# EAGLE design radio (EAGLE 9.6.2)
REVISION: 3.2; SCH_DESC: Dual ISM43340 5GHz radio transciever.; TEAM: RoboCup SSL
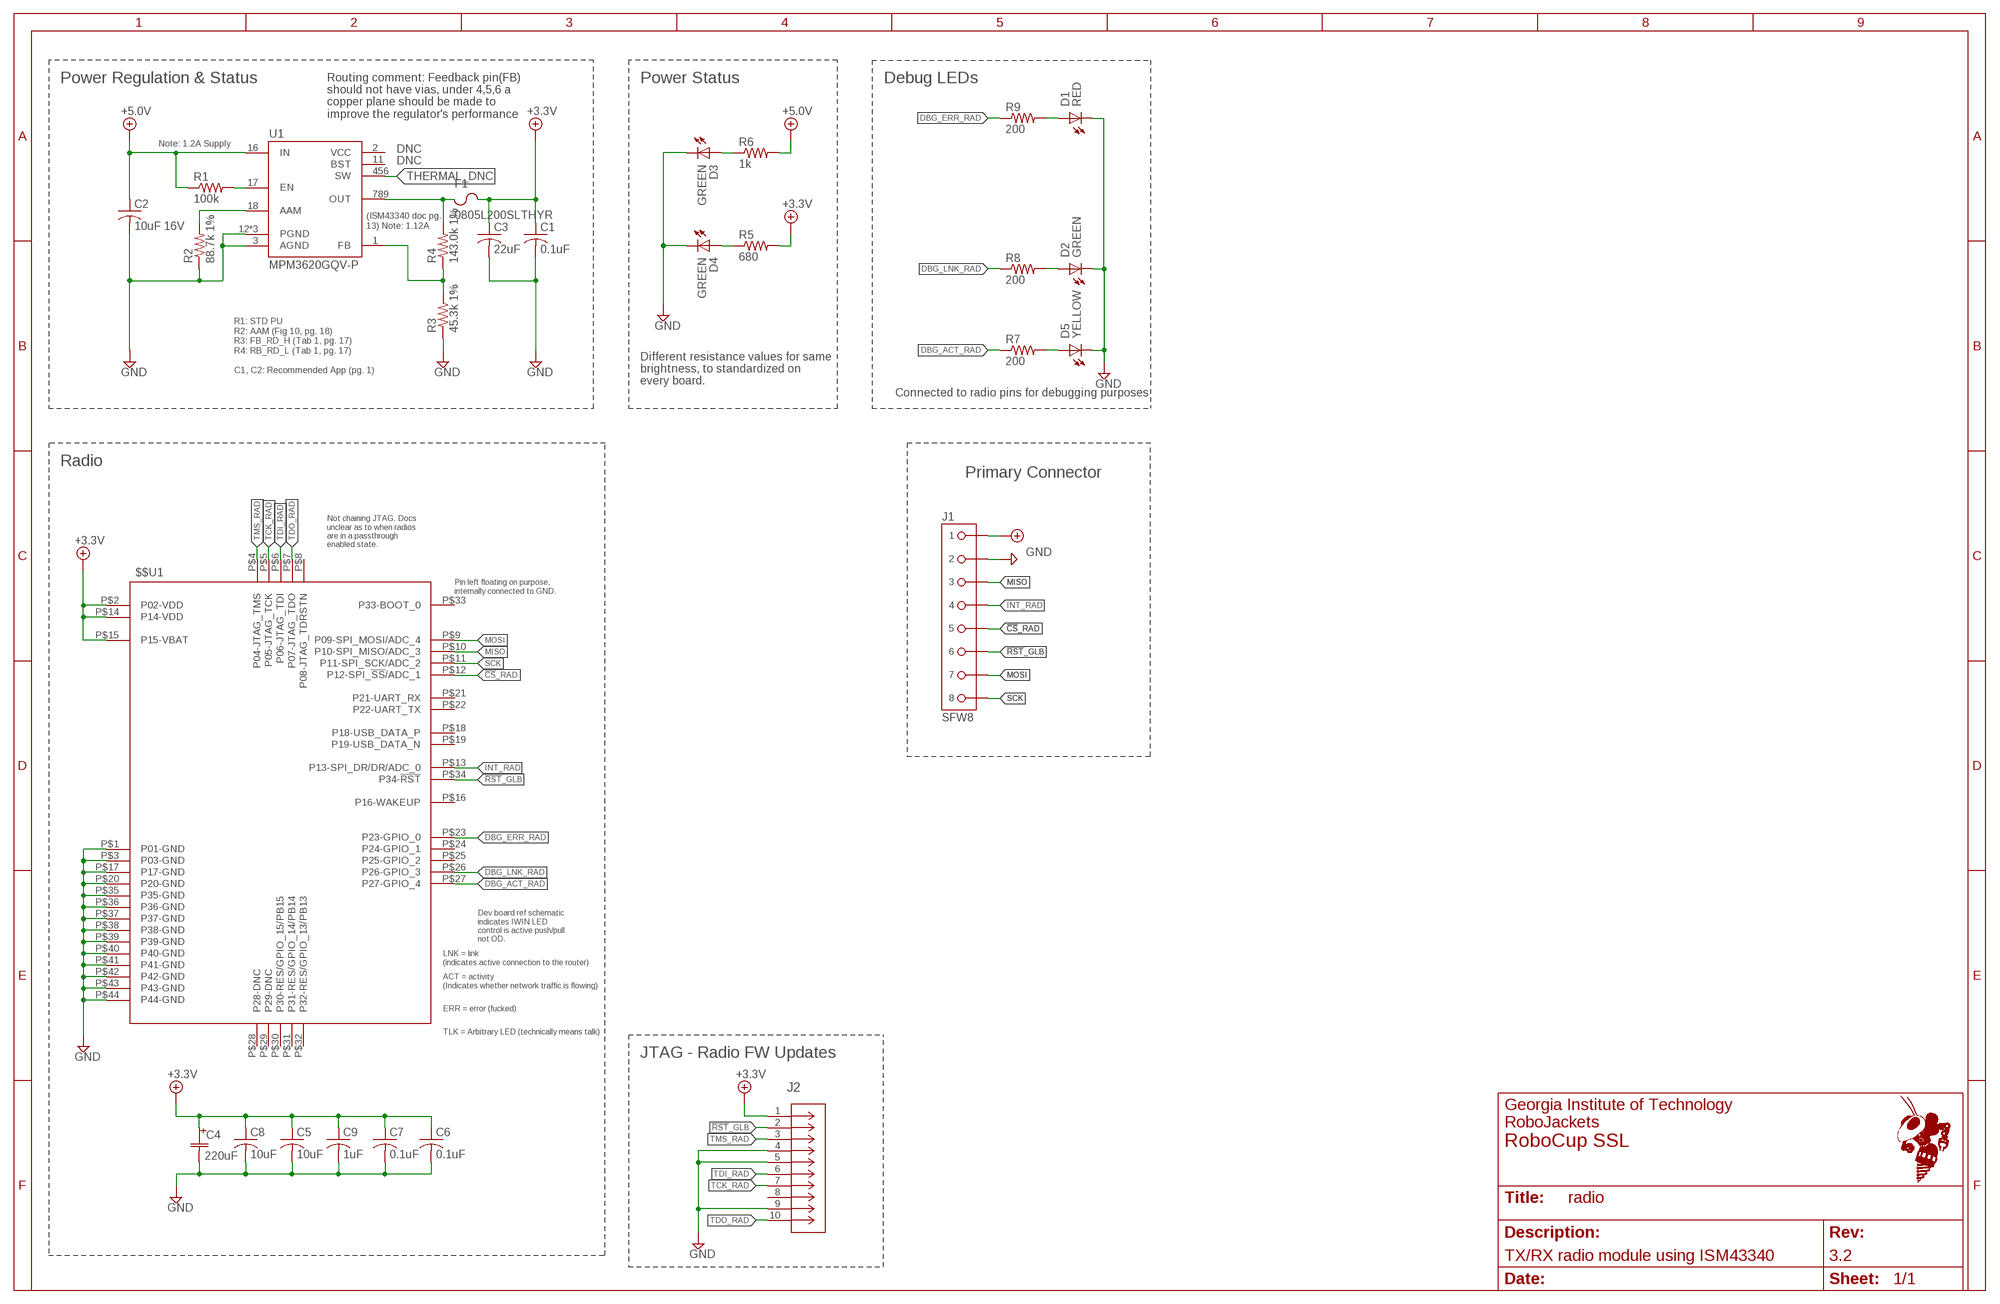
[diagram p0: schematic, sheet 1]
FRAME1 (FRAME_B_L): SCH_DESC: TX/RX radio module using ISM43340

## Parts
$$U1  ISM43340  [ISM43340]
C1  0.1uF  C-USC0603  [C0603]
C2  10uF 16V  C-USC1210  [C1210]
C3  22uF  C-USC1210  [C1210]
C4  220uF  ECA-1HHG221  [CAP_PAN_10X12.5]
C5  10uF  C-USC0805  [C0805]
C6  0.1uF  C-USC0603  [C0603]
C7  0.1uF  C-USC0603  [C0603]
C8  10uF  C-USC0805  [C0805]
C9  1uF  C-USC0603  [C0603]
D1  RED  LED-SMD-RED  [CHIP-LED0603]
D2  GREEN  LED-SMD-GREEN  [CHIP-LED0603]
D3  GREEN  LED-SMD-GREEN  [CHIP-LED0603]
D4  GREEN  LED-SMD-GREEN  [CHIP-LED0603]
D5  YELLOW  LED-SMD-YELLOW  [CHIP-LED0603]
F1  0805L200SLTHYR  CHIP_FUSE0805  [FUSC2113X75]
J1  SFW8  [SFW8R-1ST]
J2  FTSH-105-01-F-D-K  [CONN_FTSH-105-01-F-D-K_SAI]
R1  100k  R-US_R0603  [R0603]
R2  88.7k 1%  R-US_R0603  [R0603]
R3  45.3k 1%  R-US_R0603  [R0603]
R4  143.0k 1%  R-US_R0603  [R0603]
R5  680  R-US_R0603  [R0603]
R6  1k  R-US_R0603  [R0603]
R7  200  R-US_R0603  [R0603]
R8  200  R-US_R0603  [R0603]
R9  200  R-US_R0603  [R0603]
U1  MPM3620GQV-P  [MPM3620GQV-P]

## Nets
3V3_PWR_IND: D4.A R5.1
5V_PWR_IND: D3.A R6.1
!CS!_RAD: $$U1.P$12(P12-SPI_!SS!/ADC_1) J1.5
!RST!_GLB: $$U1.P$34(P34-!RST!) J1.6 J2.2
+3.3V: $$U1.P$2(P02-VDD) $$U1.P$14(P14-VDD) $$U1.P$15(P15-VBAT) C1.1 C3.1 C4.1 C5.1 C6.1 C7.1 C8.1 C9.1 F1.2 J2.1 R5.2
+5.0V: C2.1 J1.1 R1.1 R6.2 U1.16(IN)
AAM: R2.2 U1.18(AAM)
DBG_ACT_RAD: $$U1.P$27(P27-GPIO_4) R7.1
DBG_ERR: D1.A R9.2
DBG_ERR_RAD: $$U1.P$23(P23-GPIO_0) R9.1
DBG_LNK_RAD: $$U1.P$26(P26-GPIO_3) R8.1
DGB_ACT: D5.A R7.2
DGB_LNK: D2.A R8.2
EN: R1.2 U1.17(EN)
FB: R3.2 R4.1 U1.1(FB)
GND: $$U1.P$1(P01-GND) $$U1.P$3(P03-GND) $$U1.P$17(P17-GND) $$U1.P$20(P20-GND) $$U1.P$35(P35-GND) $$U1.P$36(P36-GND) $$U1.P$37(P37-GND) $$U1.P$38(P38-GND) $$U1.P$39(P39-GND) $$U1.P$40(P40-GND) $$U1.P$41(P41-GND) $$U1.P$42(P42-GND) $$U1.P$43(P43-GND) $$U1.P$44(P44-GND) C1.2 C2.2 C3.2 C4.2 C5.2 C6.2 C7.2 C8.2 C9.2 D1.C(K) D2.C(K) D3.C(K) D4.C(K) D5.C(K) J1.2 J2.4 J2.5 J2.9 R2.1 R3.1 U1.3(AGND) U1.12(PGND) U1.13(PGND) U1.14(PGND)
INT_RAD: $$U1.P$13(P13-SPI_DR/DR/ADC_0) J1.4
MISO: $$U1.P$10(P10-SPI_MISO/ADC_3) J1.3
MOSI: $$U1.P$9(P09-SPI_MOSI/ADC_4) J1.7
PRE-FUSE: F1.1 R4.2 U1.789(OUT)
SCK: $$U1.P$11(P11-SPI_SCK/ADC_2) J1.8
TCK_RAD: $$U1.P$5(P05-JTAG_TCK) J2.7
TDI_RAD: $$U1.P$6(P06-JTAG_TDI) J2.6
TDO_RAD: $$U1.P$7(P07-JTAG_TDO) J2.10
THERMAL_DNC: U1.456(SW)
TMS_RAD: $$U1.P$4(P04-JTAG_TMS) J2.3
Unconnected: $$U1.P$8(P08-JTAG_TDRSTN) $$U1.P$16(P16-WAKEUP) $$U1.P$18(P18-USB_DATA_P) $$U1.P$19(P19-USB_DATA_N) $$U1.P$21(P21-UART_RX) $$U1.P$22(P22-UART_TX) $$U1.P$24(P24-GPIO_1) $$U1.P$25(P25-GPIO_2) $$U1.P$28(P28-DNC) $$U1.P$29(P29-DNC) $$U1.P$30(P30-RES/GPIO_15/PB15) $$U1.P$31(P31-RES/GPIO_14/PB14) $$U1.P$32(P32-RES/GPIO_13/PB13) $$U1.P$33(P33-BOOT_0) J1.LEG1 J1.LEG2 J2.8 U1.2(VCC) U1.11(BST)

## Notes on the sheet
- Power Regulation & Status | Power Status | Debug LEDs
- Routing comment: Feedback pin(FB)
  should not have vias, under 4,5,6 a 
  copper plane should be made to 
  improve the regulator's performance
- Note: 1.2A Supply
- DNC
- DNC
- (ISM43340 doc pg. 
  13) Note: 1.12A
- R1: STD PU
  R2: AAM (Fig 10, pg. 18)
  R3: FB_RD_H (Tab 1, pg. 17)
  R4: RB_RD_L (Tab 1, pg. 17)
  
  C1, C2: Recommended App (pg. 1)
- Different resistance values for same
  brightness, to standardized on 
  every board.
- Connected to radio pins for debugging purposes
- Radio
- Primary Connector
- Not chaining JTAG. Docs 
  unclear as to when radios 
  are in a passthrough 
  enabled state.
- Pin left floating on purpose, 
  internally connected to GND.
- Dev board ref schematic 
  indicates IWIN LED 
  control is active push/pull 
  not OD.
- LNK = link 
  (indicates active connection to the router)
- ACT = activity 
  (Indicates whether network traffic is flowing)
- ERR = error (fucked)
- TLK = Arbitrary LED (technically means talk)
- JTAG - Radio FW Updates

## Library data of the parts
$$U1 = RoboJackets-RF:ISM43340: RX TXRX MODULE WIFI U.FL SMD Datasheet <https://www.inventeksys.com/wp-content/uploads/ISM4334x_M4G_L44_Functional_Spec.pdf>; DKPN: 1475-1050-ND
C1-C3 C5-C9 = rcl:C-US: CAPACITOR, American symbol; SPICEPREFIX: C
C4 = RoboJackets-Capacitors:ECA-1HHG221; DIGIKEY: P5572-ND; MANUFACTURER_PART_NUMBER: ECA-1HHG221
D1 = RoboJackets-LEDs:LED-SMD; DIGIKEY: 160-1447-1-ND; MPN: LTST-C191KRKT
D2-D4 = RoboJackets-LEDs:LED-SMD; DIGIKEY: 160-1446-1-ND; MPN: LTST-C191KGKT
D5 = RoboJackets-LEDs:LED-SMD; DIGIKEY: 160-1448-1-ND; MPN: LTST-C191KSKT
F1 = RoboJackets-Fuses:CHIP_FUSE
J1 = RoboJackets-Connectors:SFW8
J2 = Jlink-Connector:FTSH-105-01-F-D-K; COPYRIGHT: Copyright (C) 2022 Ultra Librarian. All rights reserved.; MANUFACTURER_PART_NUMBER: FTSH-105-01-F-D-K; MFR_NAME: Samtec Inc
R1 R2 R5-R9 = resistor:R-US_: RESISTOR, American symbol
R3 R4 = rcl:R-US_: RESISTOR, American symbol; SPICEPREFIX: R
U1 = RoboJackets-PowerICs:MPM3620GQV-P

## Board
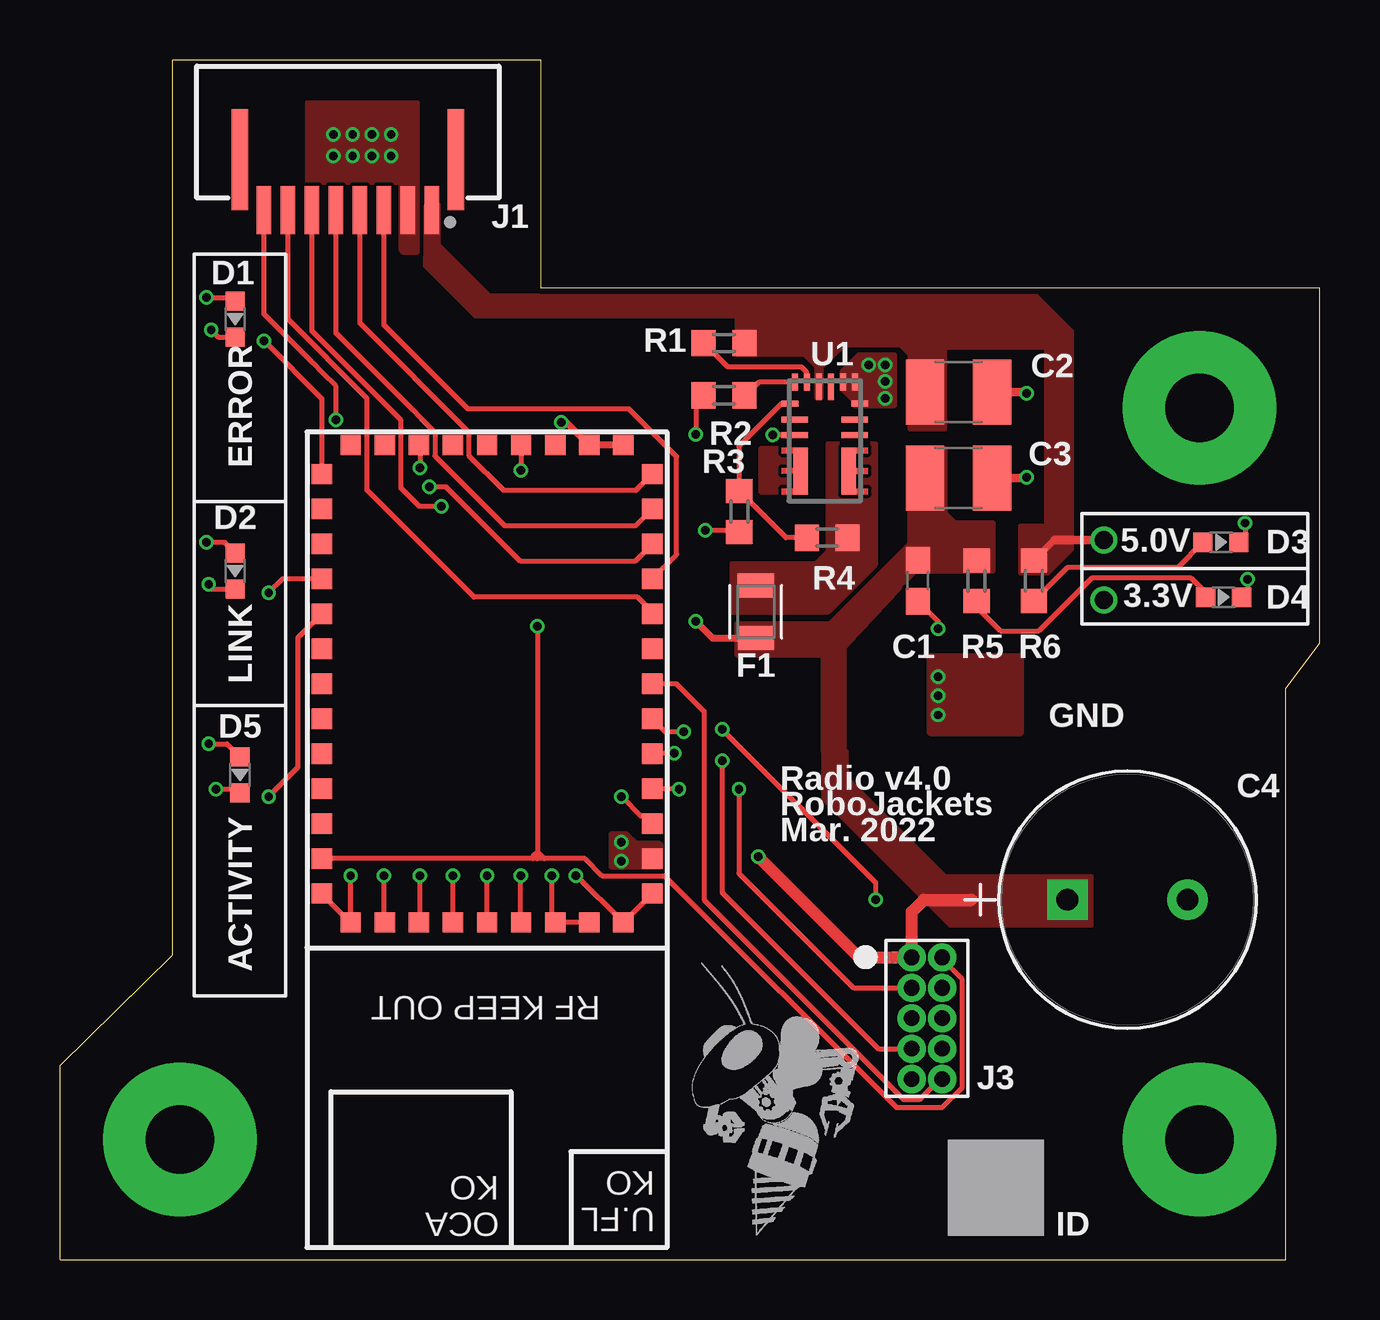
[diagram p1: board, top side]
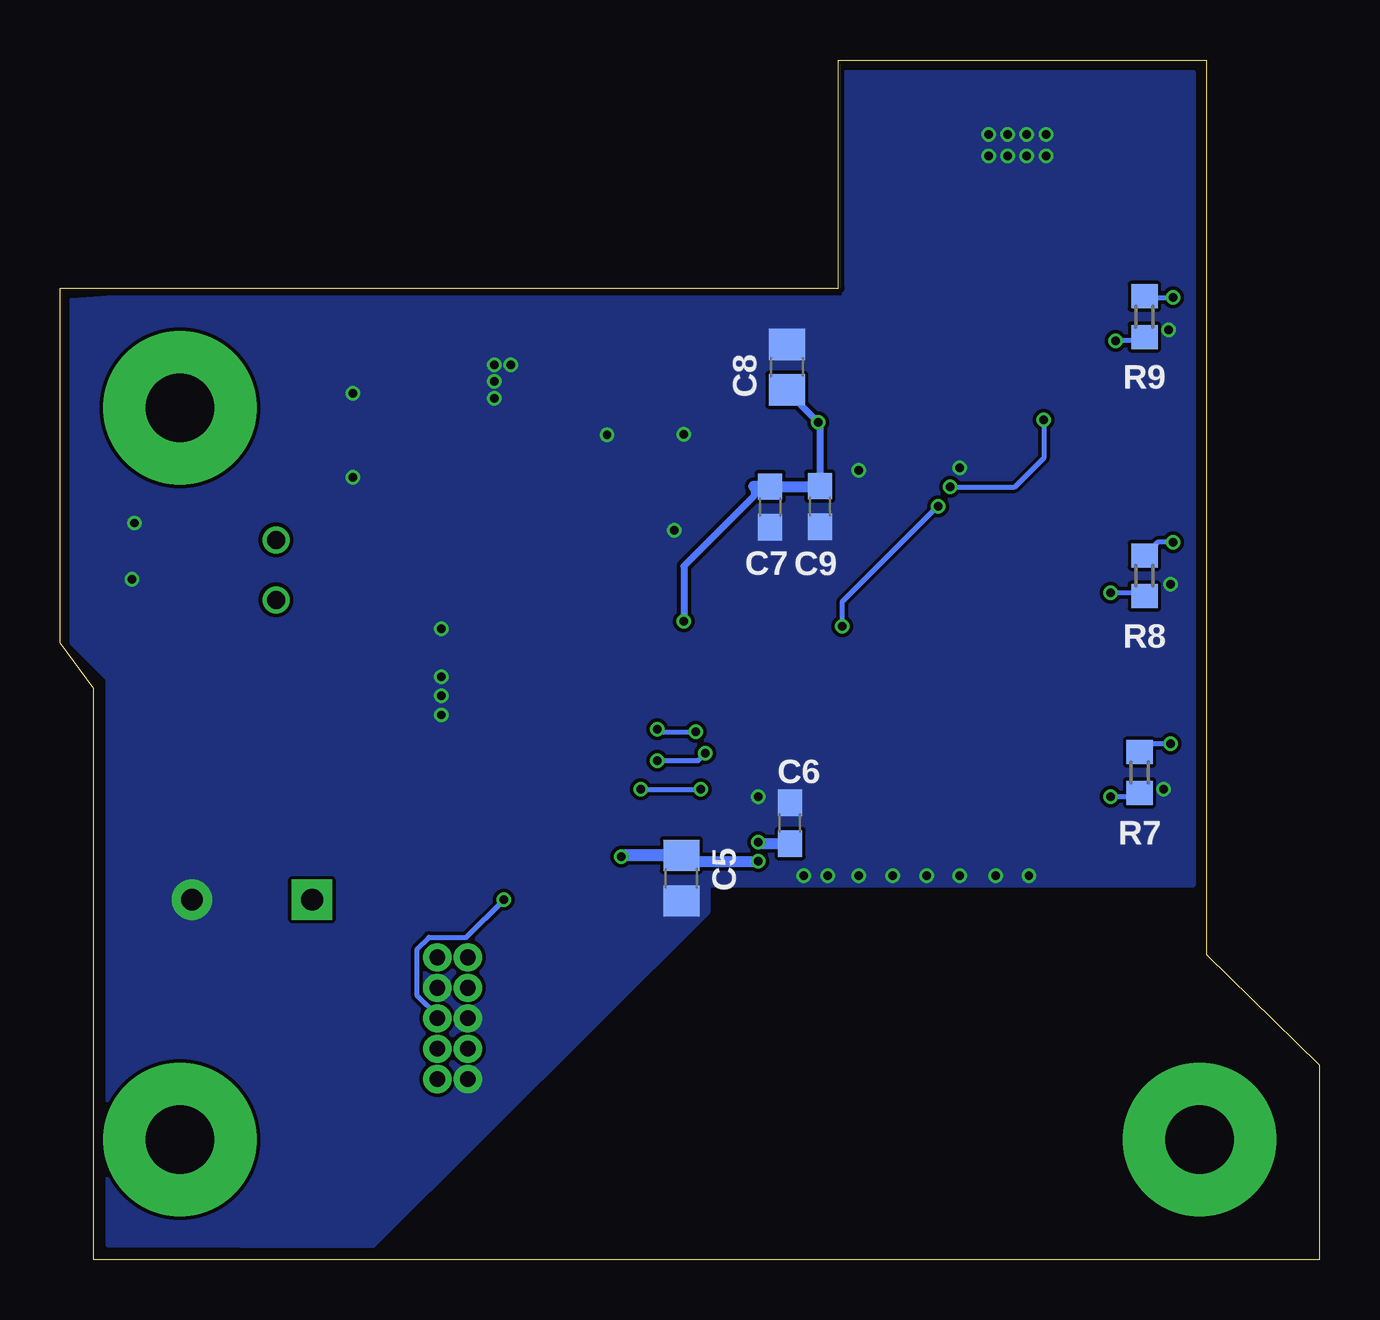
[diagram p2: board, bottom side, seen from below]

Size 52.5 x 50 mm. Coordinates in mm from the lower left corner, seen from the top.
Outline: 0,0 51.1,0 51.1,23.8 52.5,25.7 52.5,40.5 20.05,40.5 20.05,50 4.7,50 4.7,12.7 0,8.1 0,0
Copper layers (1*16): Top 0.018mm / dielectric 1.55mm / Bottom 0.018mm
Design rules "eC_2Layer_PClass6_BaseCopperO18_eCDefault *": minimum track width 0.15mm, minimum drill 0.35mm, track to track 0.15mm, track to pad 0.15mm, pad to pad 0.15mm, via to via 0.15mm, smd to smd 0mil, copper to edge 0.25mm, drill to drill 0.35mm, minimum pad ring 0.175mm, minimum via ring 0.125mm, stop-mask expansion 0mil, vias tented up to drill 0.45mm, thermal gap 0.2mm

### Footprints (pad centres in the part's own frame; a part is rotated, then mirrored left to right if it is on the bottom)
ISM43340 = smd 0.847 x 0.847: P$1 8.742,6.89; P$2 7.285,6.89; P$3 5.828,6.89; P$4 4.371,6.89; P$5 2.914,6.89; P$6 1.457,6.89; P$7 0,6.89; P$8 -1.457,6.89; P$9 -2.914,6.89; P$10 -4.371,6.89; P$11 -5.828,6.89; P$12 -7.285,6.89; P$13 -8.742,6.89; P$14 -9.948,5.684; P$15 -9.948,4.263; P$16 -9.948,2.842; P$17 -9.948,1.421; P$18 -9.948,0; P$19 -9.948,-1.421; P$20 -9.948,-2.842; P$21 -9.948,-4.263; P$22 -9.948,-5.684; P$23 -8.742,-6.89; P$24 -7.285,-6.89; P$25 -5.828,-6.89; P$26 -4.371,-6.89; P$27 -2.914,-6.89; P$28 -1.457,-6.89; P$29 0,-6.89; P$30 1.457,-6.89; P$31 2.914,-6.89; P$32 4.371,-6.89; P$33 5.828,-6.89; P$34 7.285,-6.89; P$35 8.742,-6.89; P$36 9.948,-5.684; P$37 9.948,-4.263; P$38 9.948,-2.842; P$39 9.948,-1.421; P$40 9.948,0; P$41 9.948,1.421; P$42 9.948,2.842; P$43 9.948,4.263; P$44 9.948,5.684
C0603 = smd 1.1 x 1: 1 -0.85,0; 2 0.85,0
C1210 = smd 1.6 x 2.7: 1 -1.4,0; 2 1.4,0
CAP_PAN_10X12.5 = drill 0.914 pad 1.676 square: 1 -5.004,0 | drill 0.914 pad 1.676: 2 0,0
C0805 = smd 1.3 x 1.5: 1 -0.95,0; 2 0.95,0
CHIP-LED0603 = smd 0.8 x 0.8: A 0,-0.75; C 0,0.75
FUSC2113X75 = smd 1 x 1.52: 1 -1.1,0 | smd 1 x 1.5: 2 1.1,0
SFW8R-1ST = smd 0.6 x 2: 1 -3.5,3.25; 2 -2.5,3.25; 3 -1.5,3.25; 4 -0.5,3.25; 5 0.5,3.25; 6 1.5,3.25; 7 2.5,3.25; 8 3.5,3.25 | smd 0.7 x 4.2: LEG1 -4.5,1.15; LEG2 4.5,1.15
CONN_FTSH-105-01-F-D-K_SAI = drill 0.66 pad 1.168: 1 0,0; 2 0,1.27; 3 1.27,0; 4 1.27,1.27; 5 2.54,0; 6 2.54,1.27; 7 3.81,0; 8 3.81,1.27; 9 5.08,0; 10 5.08,1.27
R0603 = smd 1 x 1.1: 1 -0.85,0; 2 0.85,0
MPM3620GQV-P = smd 0.7 x 0.25: 1 -1.45,1.55; 12 1.45,1.55 | smd 1.1 x 0.25: 2 -1.25,0.9; 3 -1.25,0.25; 10 1.25,0.25; 11 1.25,0.9 | smd 0.25 x 0.7: 13 1.25,2.45; 14 0.75,2.45; 17 -0.75,2.45; 18 -1.25,2.45 | smd 0.25 x 1.1: 15 0.25,2.25; 16 -0.25,2.25 | smd 0.6 x 1.95: 456 -1,-1.25; 789 1,-1.25

### Placement (x,y rotation side)
$$U1  17.8,24 270 top
C1  35.75,28.3 270 top
C2  37.45,36.16 0 top
C3  37.45,32.57 0 top
C4  47,15 0 top
C5  26.6,15.9 270 bottom
C6  22.07,18.19 90 bottom
C7  22.9,31.37 270 bottom
C8  22.2,37.2 90 bottom
C9  20.83,31.39 270 bottom
D1  7.3,39.2 180 top
D2  7.3,28.7 180 top
D3  48.39,29.9 270 top
D4  48.5,27.61 270 top
D5  7.5,20.2 180 top
F1  29,27 270 top
J1  12,47 180 top
J2  35.5,12.6 270 top
R1  27.68,38.2 180 top
R2  27.68,36.02 0 top
R3  28.32,31.18 90 top
R4  31.98,30.09 0 top
R5  38.2,28.3 90 top
R6  40.59,28.3 90 top
R7  7.5,20.3 90 bottom
R8  7.3,28.5 90 bottom
R9  7.3,39.3 90 bottom
U1  31.88,34.12 0 top
U$2  [ROBOBUZZ_0.6X]  29,1 0 top

### Tracks (layer width: path | path; a pad name or v marks a point on that pad's centre or on a via)
3V3_PWR_IND
  Top 0.2: D4.A 47.75,27.8 47.16,28.4 43,28.4 40.8,26.2 39.2,26.2 38.2,27.2 R5.1
5V_PWR_IND
  Top 0.2: D3.A 46.59,28.84 41.99,28.84 R6.1
!CS!_RAD
  Top 0.2: $$U1.P$12 24,30.59 18.54,30.59 15.63,33.49 15.63,34.48 15.05,35.05 14.67,35.44 11.5,38.61 J1.5
!RST!_GLB  (via drill 0.35)
  Top 0.2: 20.18,16.71 21.89,16.71 22.6,16 25.2,16 34.86,6.34 36.77,6.34 37.6,7.17 37.6,11.68 36.77,12.51 J2.2 | 20.18,16.71 19.9,16.71 | 19.9,16.71 19.7,16.71 | 19.7,16.71 $$U1.P$34 | v19.9,26.4 19.9,17 | 19.9,17 19.9,16.71 | 19.9,17 19.7,16.8 19.7,16.71 | 19.9,17 20.18,16.71 | v15.9,31.4 14.96,31.4 14.21,32.15 14.21,34.98 10.5,38.69 J1.6
  Bottom 0.2: v15.9,31.4 19.9,27.4 v19.9,26.4
+3.3V  (via drill 0.35)
  Top 0.2: $$U1.P$15
  Top 0.3: v20.9,34.9 21.1,34.9 $$U1.P$15 $$U1.P$14 | v26.5,26.6 27.2,25.9 F1.2
  Top 0.5: v29.1,16.8 33.3,12.6 J2.1 35.5,14.5 36,15 38,15
  Bottom 0.3: C9.1 20.83,34.83 v20.9,34.9 22.2,36.2 C8.1 | v26.5,26.6 26.5,28.9 23.58,31.82 23.58,32.22 | C5.1 26.35,16.6 | v23.4,17.4 23.34,17.34
  Bottom 0.45: 23.58,32.22 C7.1 20.85,32.22 C9.1 | 26.35,16.6 v23.4,16.6 | 23.34,17.34 C6.1
  Bottom 0.5: C5.1 29.1,16.85 v29.1,16.8
  pour Top (no thermals): 31.8,26.2 31.8,21.2 32.7,21.2 32.7,25.52 35.66,28.7 38.9,28.7 38.9,30.7 37.3,30.7 36.9,31.1 36.9,33.8 35.4,33.8 35.4,29.8
  pour Top (no thermals): 25,17.3 24,17.3 23.6,17.7 23,17.7 23,16.4 25,16.4
  pour Top (no thermals): 31.8,21.2 31.8,19.2 37.1,13.9 43,13.9 43,16 36.9,16 32.8,20.1 32.8,21.2
  pour Top (no thermals): 28.2,26.5 28.2,25.2 32,25.2 32,26.5
+5.0V  (via drill 0.75 pad 0.85)
  Top 0.3: 41.45,30 R6.2
  Top 0.35: v43.5,30 41.45,30
  pour Top (rank 5, no thermals): 28.2,39.3 28.2,37.7 31,37.7 31.5,37.2 31.5,35.9 31.75,35.9 31.75,37.2 32.7,38.1 35,38.1 35.4,37.7 35.4,34.6 36.9,34.6 36.9,38 41.1,38 41.1,30.6 40,30.6 40,28.6 41.2,28.6 42.2,29.6 42.2,38.7 40.7,40.2 17.9,40.2 15.8,42.3 15.8,44 15.3,44 15.2,43.9 15.2,41.4 17.3,39.3
AAM
  Top 0.2: U1.18 29.13,36.57 28.58,36.02 R2.2
BOLT1  (via drill 2.85 pad 6.4)
  other vias: 47.5,35.5
BOLT2  (via drill 2.85 pad 6.4)
  other vias: 47.5,5
BOLT3  (via drill 2.85 pad 6.4)
  other vias: 5,5
DBG_ACT_RAD  (via drill 0.35)
  Top 0.2: v8.7,19.3 9.93,20.53 9.93,25.93 $$U1.P$27
  Bottom 0.2: 7.65,19.3 7.5,19.15 | v8.7,19.3 7.65,19.3 | R7.1 7.65,19.3
DBG_ERR  (via drill 0.35)
  Top 0.2: v6.1,40.1 7.15,40.1 D1.A
  Bottom 0.2: R9.2 7.25,40.1 v6.1,40.1
DBG_ERR_RAD  (via drill 0.35)
  Top 0.2: v8.5,38.3 10.91,35.89 $$U1.P$23
  Bottom 0.2: R9.1 7.45,38.3 v8.5,38.3
DBG_LNK_RAD  (via drill 0.35)
  Top 0.2: $$U1.P$26 9.27,28.37 v8.7,27.8
  Bottom 0.2: v8.7,27.8 7.45,27.8 R8.1
DGB_ACT  (via drill 0.35)
  Top 0.2: D5.A 6.95,21.5 v6.2,21.5
  Bottom 0.2: R7.2 7.15,21.5 v6.2,21.5
DGB_LNK  (via drill 0.35)
  Top 0.2: v6.1,29.9 6.85,29.9 D2.A
  Bottom 0.2: v6.1,29.9 6.75,29.9 R8.2
EN
  Top 0.152: 27.87,37.2 27.84,37.2
  Top 0.2: U1.17 31.13,36.97 30.9,37.2 28,37.2 | 28,37.2 27.87,37.2 | R1.2 27.84,37.2 28,37.2
FB
  Top 0.2: U1.1 30.07,35.67 28.3,33.9 28.3,32.05 R3.2 30.26,30.09 R4.1
GND  (via drill 0.35)
  Top 0.2: v23.4,19.3 24.23,18.47 24.39,18.47 $$U1.P$3 | v20.5,16 20.5,14.19 $$U1.P$42 $$U1.P$43 | $$U1.P$40 v17.8,16 | $$U1.P$38 15,14.05 v15,16 | $$U1.P$37 13.5,14.09 v13.5,16 | C1.2 36.6,26.59 v36.6,26.3 | $$U1.P$20 15,33.91 v15,33 | $$U1.P$17 19.22,32.92 v19.2,32.9 | R2.1 26.5,35.69 v26.5,34.4 | v40.3,32.6 40.27,32.57 | v40.3,36.1 40.24,36.16 | v49.5,28.35 49.5,27.86 D4.C | D3.C 49.4,30.16 v49.4,30.7 | $$U1.P$41 19.2,14.07 v19.2,16 | $$U1.P$39 v16.38,16 | v26.9,30.4 28.25,30.4 R3.1 | U1.3 v29.7,34.37 | $$U1.P$35 10.9,15.25 12.1,14.05 $$U1.P$36 v12.12,16 | $$U1.P$1 24.7,15.25 24.68,15.25 $$U1.P$44 21.54,16 v21.5,16 | v6.2,28.15 6.2,28.05 6.3,27.95 D2.C | v6.3,38.75 6.6,38.45 D1.C | v6.5,19.6 7.35,19.6 D5.C
  Top 0.35: 40.27,32.57 C3.2 | 40.24,36.16 C2.2
  other vias: 33.7,37.3 34.4,37.3 34.4,36.6 34.4,35.9 36.6,22.7 36.6,23.5 36.6,24.3 11.4,46 11.4,46.9 12.2,46 12.2,46.9 13,46.9 13,46 13.8,46.9 13.8,46
  pour Bottom (no thermals): 25.5,15.6 25.5,14.49 39.48,0.55 50.5,0.6 50.5,24.2 52,25.7 52,40 50.5,40.1 19.8,40.1 19.8,49.5 5.27,49.5 5.27,15.6
  pour Top (no thermals): 34.8,37.7 33.3,37.7 32.6,37 32.6,36.3 33.1,35.8 33.1,35.6 34.8,35.6
  pour Top (no thermals): 36.3,25.1 36.3,22 40,22 40,25.1
  pour Top (no thermals): 14.2,44.9 14.2,42.1 14.3,42 14.9,42 14.9,48.2 10.3,48.2 10.3,44.9
INT_RAD
  Top 0.2: $$U1.P$13 24.01,32.07 18.48,32.07 17.05,33.49 17.05,34.48 12.5,39.03 J1.4
MISO
  Top 0.2: $$U1.P$10 25.7,29.39 25.7,33.48 23.73,35.45 17,35.45 13.5,38.95 J1.3
MOSI
  Top 0.2: $$U1.P$9 24.77,26.91 24.07,27.61 17.25,27.61 12.8,32.07 12.8,35.9 9.5,39.2 J1.7
N$1  (via drill 0.75 pad 0.85)
  other vias: 43.5,27.5
PRE-FUSE
  Top 0.3: R4.2 32.88,30.14
  pour Top (no thermals): 34,34 32,34 32,29.5 31.5,29 28,29 28,27 32,27 34,29
SCK  (via drill 0.35)
  Top 0.2: $$U1.P$11 23.96,29.1 19.2,29.1 16.1,32.2 v15.4,32.2 | v11.5,35 11.5,36.4 10.95,36.95 10.5,37.4 8.5,39.4 J1.8
  Bottom 0.2: v15.4,32.2 12.7,32.2 11.5,33.4 v11.5,35
TCK_RAD  (via drill 0.35)
  Top 0.2: v25.6,21.1 25.59,21.09 $$U1.P$5 | v27.6,20.8 27.6,15.3 31.95,10.95 32.3,10.6 34.11,8.79 J2.7
  Bottom 0.2: v27.6,20.8 25.9,20.8 v25.6,21.1
TDI_RAD  (via drill 0.35)
  Top 0.2: v26,22 25.23,22 $$U1.P$6 | v34,15 34,15.7 v27.6,22.1
  Bottom 0.2: v27.6,22.1 27.5,22 v26,22 | v34,15 35.57,13.43 37.12,13.43 37.6,12.95 37.6,10.98 36.77,10.15 J2.6
TDO_RAD
  Top 0.2: $$U1.P$7 25.69,24 26.84,22.84 26.84,14.99 35.15,6.69 35.85,6.69 36.68,7.52 J2.10
THERMAL_DNC
  pour Top (no thermals): 31.1,33.8 29.2,33.8 29.2,32 31.1,32
TMS_RAD  (via drill 0.35)
  Top 0.2: $$U1.P$4 25.77,19.63 v25.8,19.6 | v28.3,19.6 28.3,16.1 33.07,11.33 J2.3
  Bottom 0.2: v28.3,19.6 v25.8,19.6

### Text on the board
tPlace: ERROR | 5.0V | 3.3V | LINK | ACTIVITY | J3 | ID
tNames: GND | Radio v4.0 / RoboJackets / Mar. 2022